# Altium schematic sheet POE_PD.SchDoc
size A3; SheetNumber: 14; SheetTotal: 16
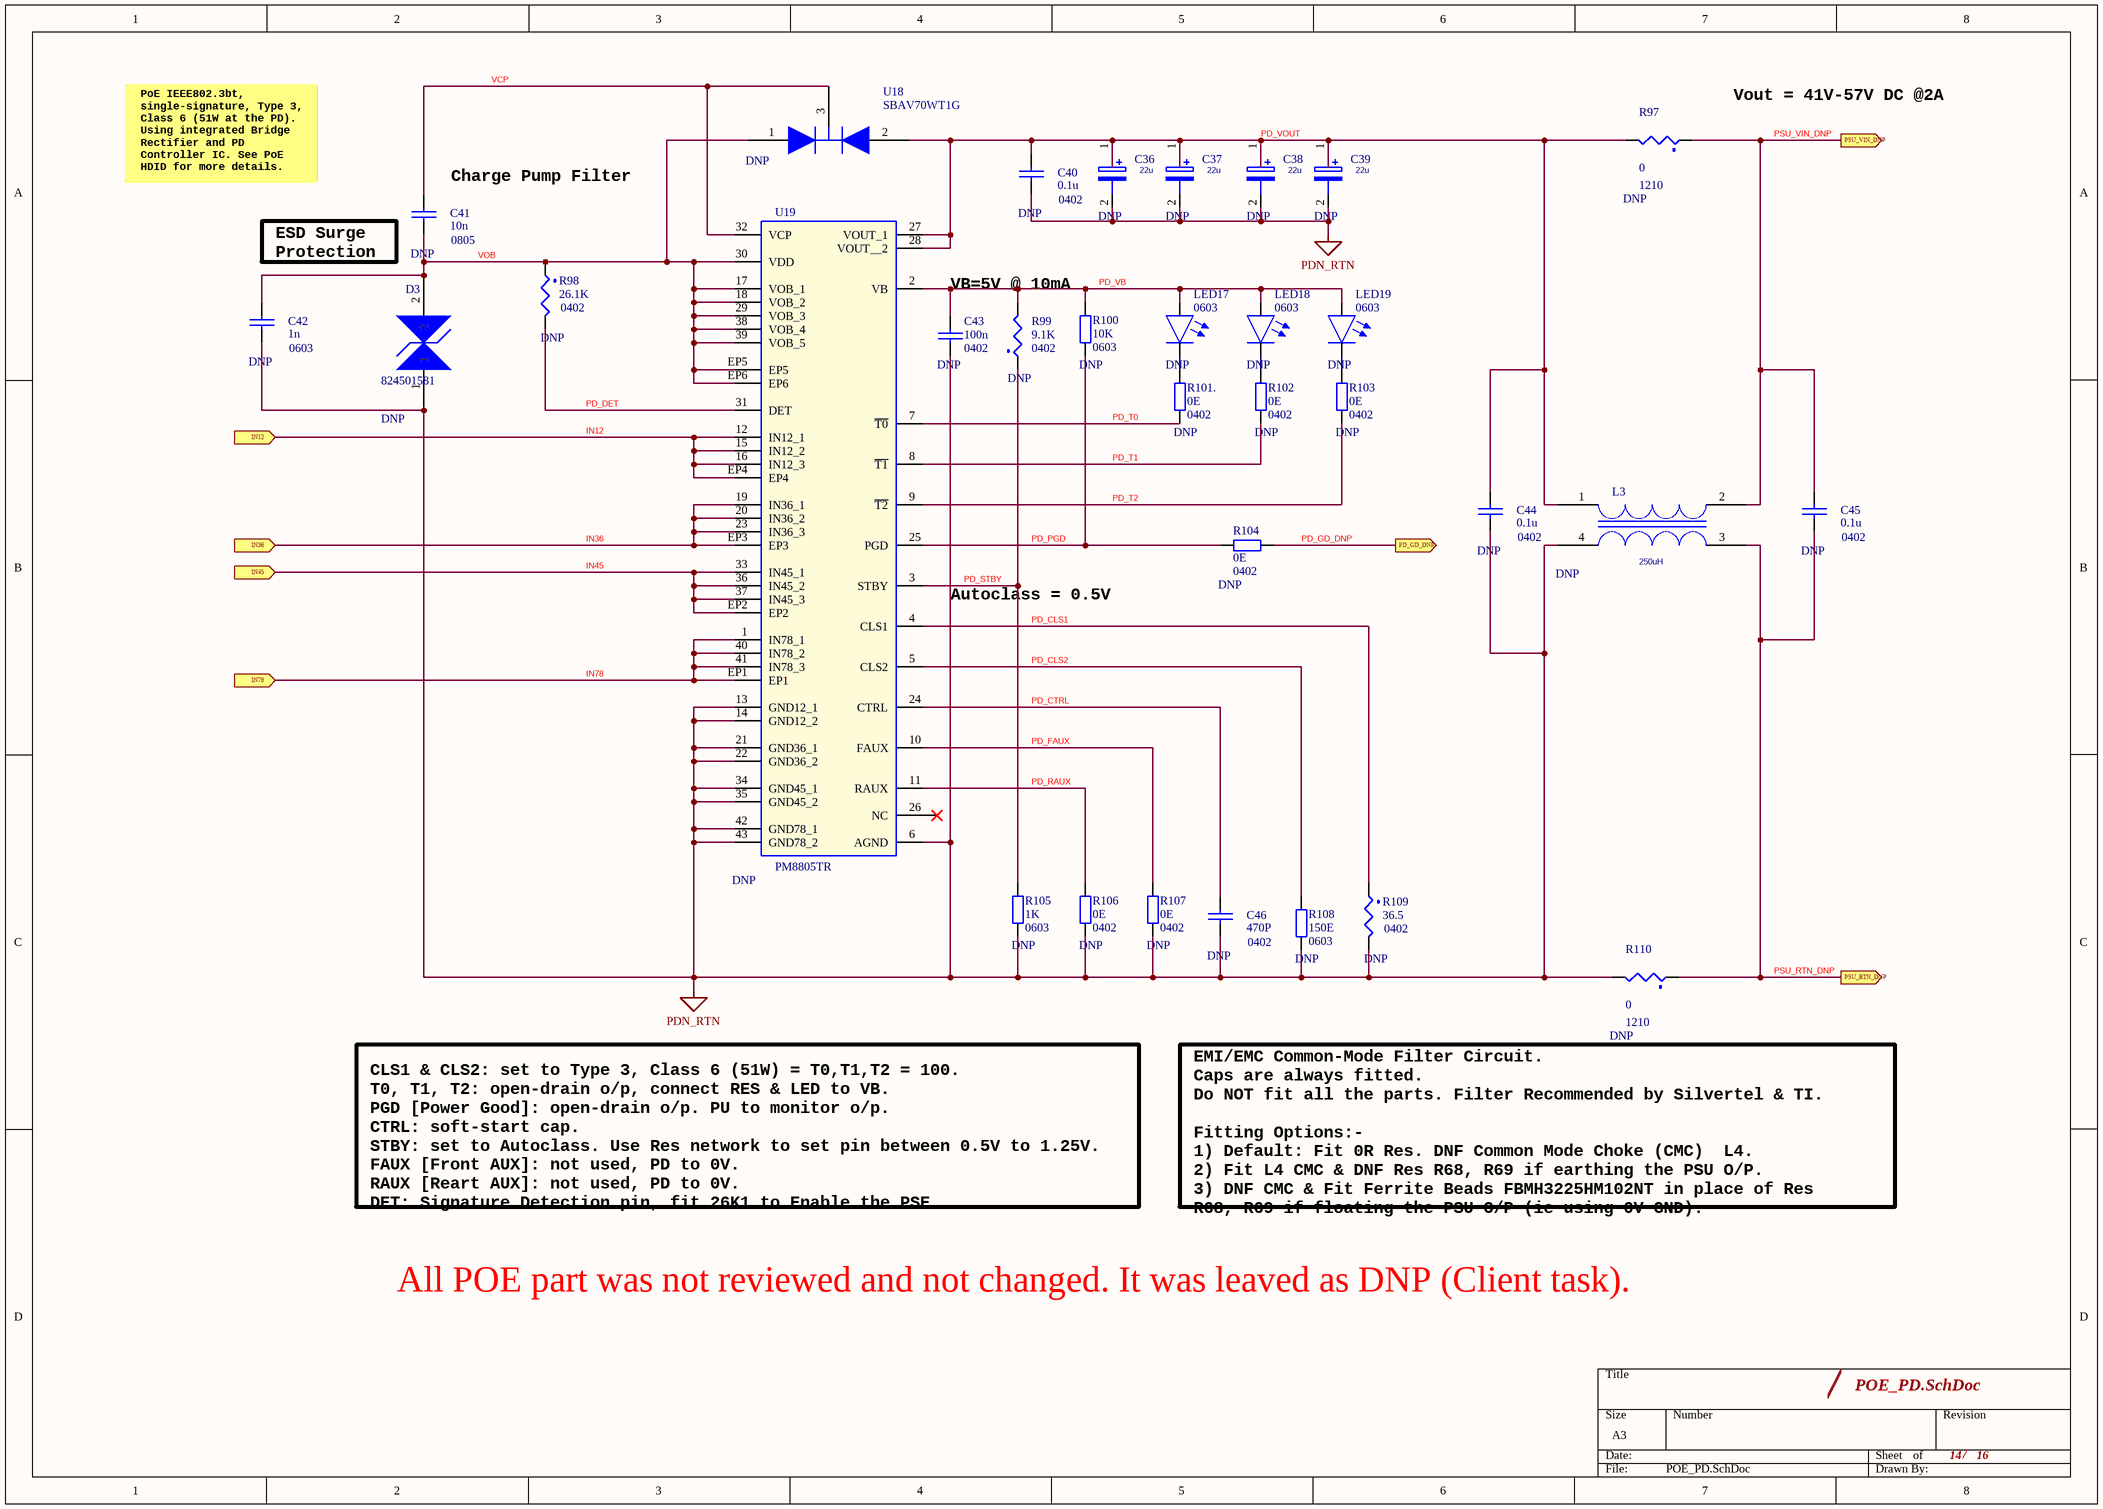
[diagram p0: POE_PD.SchDoc]

## Parts
C36  CAP_V: 22u  [CAPAE830X550N]  (hidden comment: UWX1H220MCL1GB)
C37  CAP_V: 22u  [CAPAE830X550N]  (hidden comment: UWX1H220MCL1GB)
C38  CAP_V: 22u  [CAPAE830X550N]  (hidden comment: UWX1H220MCL1GB)
C39  CAP_V: 22u  [CAPAE830X550N]  (hidden comment: UWX1H220MCL1GB)
C40  0.1u  Foot Print Type: 0402  [c_np_0402]
C41  10n  Foot Print Type: 0805  [cap_sm_0805]
C42  1n  Foot Print Type: 0603  [c_cs_0603]
C43  100n  Foot Print Type: 0402  [c_np_0402]
C44  0.1u  Foot Print Type: 0402  [c_np_0402]
C45  0.1u  Foot Print Type: 0402  [c_np_0402]
C46  470P  Foot Print Type: 0402  [c_np_0402]
D3  824501581  [824501581]
L3  INDUCTANCE: 250uH  [744272251]  (hidden comment: 744272251)
LED17  Size: 0603  [LED_0603(1608)]  (hidden comment: 150060GS75000)
LED18  Size: 0603  [LED_0603(1608)]  (hidden comment: 150060GS75000)
LED19  Size: 0603  [LED_0603(1608)]  (hidden comment: 150060GS75000)
R97  0  Foot Print Size: 1210  [r_sm_1210]
R98  26.1K  Foot Print Size: 0402  [r_sm_0402_r]
R99  9.1K  Foot Print Size: 0402  [r_sm_0402_r]
R100  Resistance: 10K  Size2: 0603  [RESC160X80X55L30]  (hidden comment: RC0603FR-0710KL)
R101.  Resistance: 0E  Size2: 0402  [RESC100X50X40L25]  (hidden comment: AC0402JR-071KL)
R102  Resistance: 0E  Size2: 0402  [RESC100X50X40L25]  (hidden comment: AC0402JR-071KL)
R103  Resistance: 0E  Size2: 0402  [RESC100X50X40L25]  (hidden comment: AC0402JR-071KL)
R104  Resistance: 0E  Size2: 0402  [RESC100X50X40L25]  (hidden comment: AC0402JR-070RL)
R105  Resistance: 1K  Size2: 0603  [RESC160X80X55L30]  (hidden comment: RC0603FR-071KL)
R106  Resistance: 0E  Size2: 0402  [RESC100X50X40L25]  (hidden comment: AC0402JR-070RL)
R107  Resistance: 0E  Size2: 0402  [RESC100X50X40L25]  (hidden comment: AC0402JR-070RL)
R108  Resistance: 150E  Size2: 0603  [RESC160X80X55L30]  (hidden comment: RC0603JR-07150RL)
R109  36.5  Foot Print Size: 0402  [r_sm_0402_r]
R110  0  Foot Print Size: 1210  [r_sm_1210]
U18  SBAV70WT1G  [SOT-323-3_2P2X1P35_ONS]
U19  PM8805TR  [XCVR_PM8805TR]

## Ports
IN12 (in), IN36 (in), IN45 (in), IN78 (in), PD_GD_DNP (out), PSU_RTN_DNP (out), PSU_VIN_DNP (out)

## Nets
PDN_RTN: C36.2(M) C37.2(M) C38.2(M) C39.2(M) C40.2 C42.2 C43.2 C44.2 C46.2 D3.1 L3.4 R105.2 R106.2 R107.2 R108.2 R109.2 R110.2 U19.6(AGND) U19.13(GND12_1) U19.14(GND12_2) U19.21(GND36_1) U19.22(GND36_2) U19.34(GND45_1) U19.35(GND45_2) U19.42(GND78_1) U19.43(GND78_2)
IN12: U19.12(IN12_1) U19.15(IN12_2) U19.16(IN12_3) U19.EP4 ; port IN12
IN36: U19.19(IN36_1) U19.20(IN36_2) U19.23(IN36_3) U19.EP3 ; port IN36
IN45: U19.33(IN45_1) U19.36(IN45_2) U19.37(IN45_3) U19.EP2 ; port IN45
IN78: U19.1(IN78_1) U19.40(IN78_2) U19.41(IN78_3) U19.EP1 ; port IN78
PD_CLS1: R109.1 U19.4(CLS1)
PD_CLS2: R108.1 U19.5(CLS2)
PD_CTRL: C46.1 U19.24(CTRL)
PD_DET: R98.2 U19.31(DET)
PD_FAUX: R107.1 U19.10(FAUX)
PD_GD_DNP: R104.2 ; port PD_GD_DNP
PD_PGD: R100.2 R104.1 U19.25(PGD)
PD_RAUX: R106.1 U19.11(RAUX)
PD_STBY: R99.1 R105.1 U19.3(STBY)
PD_T0: R101..1 U19.7(~{T0})
PD_T1: R102.1 U19.8(~{T1})
PD_T2: R103.1 U19.9(~{T2})
PD_VB: C43.1 LED17.1(Anode) LED18.1(Anode) LED19.1(Anode) R99.2 R100.1 U19.2(VB)
PD_VOUT: C36.1(P) C37.1(P) C38.1(P) C39.1(P) C40.1 C44.1 L3.1 R97.2 U18.2(ANODE_1) U19.27(VOUT_1) U19.28(VOUT__2)
PSU_RTN_DNP: C45.2 L3.3 R110.1 ; port PSU_RTN_DNP
PSU_VIN_DNP: C45.1 L3.2 R97.1 ; port PSU_VIN_DNP
VCP: C41.1 U18.3(CATHODE) U19.32(VCP)
VOB: C41.2 C42.1 D3.2 R98.1 U18.1(ANODE) U19.17(VOB_1) U19.18(VOB_2) U19.29(VOB_3) U19.30(VDD) U19.38(VOB_4) U19.39(VOB_5) U19.EP5 U19.EP6
NetLED17_2: LED17.2(Chatode) R101..2
NetLED18_2: LED18.2(Chatode) R102.2
NetLED19_2: LED19.2(Chatode) R103.2

Not connected (* = marked no-connect by the designer): U19 26(NC)*

## Notes on the sheet
- Vout = 41V-57V DC @2A
- PoE IEEE802.3bt,
  single-signature, Type 3,
  Class 6 (51W at the PD).
  Using integrated Bridge
  Rectifier and PD
  Controller IC. See PoE
  HDID for more details.
- (near C41) Charge Pump Filter
- (near C41) ESD Surge
  Protection
- VB=5V @ 10mA
- Autoclass = 0.5V
- CLS1 & CLS2: set to Type 3, Class 6 (51W) = T0,T1,T2 = 100.
  T0, T1, T2: open-drain o/p, connect RES & LED to VB.
  PGD [Power Good]: open-drain o/p. PU to monitor o/p.
  CTRL: soft-start cap.
  STBY: set to Autoclass. Use Res network to set pin between 0.5V to 1.25V.
  FAUX [Front AUX]: not used, PD to 0V.
  RAUX [Reart AUX]: not used, PD to 0V.
  DET: Signature Detection pin, fit 26K1 to Enable the PSE.
- EMI/EMC Common-Mode Filter Circuit.
  Caps are always fitted.
  Do NOT fit all the parts. Filter Recommended by Silvertel & TI.
  Fitting Options:-
  1) Default: Fit 0R Res. DNF Common Mode Choke (CMC)  L4.
  2) Fit L4 CMC & DNF Res R68, R69 if earthing the PSU O/P.
  3) DNF CMC & Fit Ferrite Beads FBMH3225HM102NT in place of Res
  R68, R69 if floating the PSU O/P (ie using 0V GND).
- All POE part was not reviewed and not changed. It was leaved as DNP (Client task).
- /

## Library data of the parts
C36-C39 = UWX1H220MCL1GB: Nichicon 22uF 50 V Aluminium Electrolytic Capacitor SMD, WX Series 2000h 8 (Dia.) x 5.4mm; OriginalSymbolOrigin: (0,0); PCB Footprint: cap_sm_1210; DeviceNumbering: Alpha; DeviceDesignator: A; DevicesInPackage: 1; IsHeterogeneous: False; Voltage: 65V; Tollerance: 5%; Height: 5.5 mm; Datasheet Link: http://www.nichicon.co.jp/english/products/pdfs/e-uwx.pdf; Arrow Price/Stock: https://www.arrow.com/en/products/uwx1h220mcl1gb/nichicon; Arrow Part Number: UWX1H220MCL1GB; Mouser Part Number: 647-UWX1H220MCL1; Manufacturer_Part_Number: UWX1H220MCL1GB; Manufacturer_Name: Nichicon; DevicesInView: 1; PackageName: UWX1H220MCL1GB; DNP: DNP
C40 = CAP_NP: CLASS: DISCRETE; Tollerance: 5%; Voltage: 50V; PCB Footprint: c_np_0402; DNP: DNP
C41 = CAP_NP: CLASS: DISCRETE; Tollerance: 1%; Voltage: 50V; PCB Footprint: cap_sm_0805; DNP: DNP
C42 C46 = CAP_NP: CLASS: DISCRETE; Voltage: 50V; Tollerance: 1%; DNP: DNP
  C42: PCB Footprint: c_cs_0603
  C46: PCB Footprint: c_np_0402
C43 = CAP_NP: CLASS: DISCRETE; PCB Footprint: c_np_0402; DNP: DNP
C44 C45 = CAP_NP: CLASS: DISCRETE; Voltage: 50V; Tollerance: 5%; PCB Footprint: c_np_0402; DNP: DNP
LED17-LED19 = LED_0603_SMD: LED GREEN CLEAR 0603 SMD; MPN: 150060GS75000; ComponentLink1Description: DigiKey; ComponentLink1URL: https://www.digikey.com/en/products/detail/w%C3%BCrth-elektronik/150060gs75000/4489898; DNP: DNP
R97 = SMD_RESISTOR: Voltage: 50V; Tollerance: 5%; PCB Footprint: r_sm_1210; DNP: DNP
R98 R99 = SMD_RESISTOR: Tollerance: 1%; Voltage: 50V; PCB Footprint: r_sm_0402_r; DNP: DNP
R100 = CMP-001-0628-7: RES 10K OHM 1% 1/10W 0603; Manufacturer: YAGEO; Power: 100mW; Temperature Coefficient: ±100ppm; Op Temp max: 155°C; Op Temp min: -55°C; PMNT: DNP; Ratings: -; ComponentLink3URL: https://www.digikey.com/en/products/detail/yageo/RC0603FR-0710KL/726880?s=N4IgTCBcDaIEoGEAMA2JBmAYnAtEg7AIxIDSAMiALoC%2BQA; Size: 1.60mm x 0.80mm; ComponentLink1Description: Datasheet; ComponentLink3Description: Digikey; ComponentLink2Description: Mouser; ComponentLink1URL: https://www.yageo.com/upload/media/product/products/datasheet/rchip/PYu-RC_51_RoHS_P_4.pdf; Composition: Thick Film; Package: 0603 (1608 Metric); ComponentLink2URL: https://eu.mouser.com/ProductDetail/YAGEO/RC0603FR-0710KL?qs=grNVn54RoB%252B3GtjbJj3wJQ%3D%3D; Mounting Type: SM; Tolerance: 1%; Height max: 550µm; MPN: RC0603FR-0710KL; Component Type: Chip Resistor; DNP: DNP
R101. R102 R103 = CMP-001-0484-6: RES SMD 1K OHM 1/16W 0402; Manufacturer: YAGEO; Power: 63mW; Op Temp min: -55°C; Temperature Coefficient: ±100ppm; Op Temp max: 155°C; ComponentLink3URL: https://www.digikey.com/en/products/detail/yageo/ac0402jr-071kl/5895603; Ratings: -; Height max: 400µm; MPN: AC0402JR-071KL; Size: 1.00mm x 0.50mm; Composition: Thick Film; Package: 0402 (1005 Metric); ComponentLink3Description: Digikey; Mounting Type: SM; Component Type: Chip Resistor; DNP: DNP
R104 R106 R107 = CMP-001-0484-6: RES SMD 0 OHM JUMPER 1/16W 0402; Manufacturer: YAGEO; Power: 63mW; Op Temp min: -55°C; Temperature Coefficient: ±100ppm; Op Temp max: 155°C; ComponentLink3URL: https://www.digikey.com/en/products/detail/yageo/RC0402FR-0727RL/5280946; ComponentLink2Description: Mouser; Ratings: -; Tolerance: Jumper; Height max: 400µm; MPN: AC0402JR-070RL; ComponentLink1URL: https://www.yageo.com/upload/media/product/productsearch/datasheet/rchip/PYu-RC_Group_51_RoHS_L_12.pdf; Size: 1.00mm x 0.50mm; Composition: Thick Film; Package: 0402 (1005 Metric); ComponentLink3Description: Digikey; Mounting Type: SM; ComponentLink2URL: https://eu.mouser.com/ProductDetail/YAGEO/RC0402FR-0727RL?qs=UOUeRUa%252B8Wlb37UyFHw9Bw%3D%3D; ComponentLink1Description: Datasheet; Component Type: Chip Resistor; DNP: DNP
R105 = CMP-001-0628-7: RES 1K OHM 1% 1/10W 0603; Manufacturer: YAGEO; Power: 100mW; Temperature Coefficient: ±100ppm; Op Temp max: 155°C; Op Temp min: -55°C; Ratings: -; ComponentLink3URL: https://www.digikey.com/en/products/detail/yageo/RC0603FR-0710KL/726880?s=N4IgTCBcDaIEoGEAMA2JBmAYnAtEg7AIxIDSAMiALoC%2BQA; Size: 1.60mm x 0.80mm; ComponentLink1Description: Datasheet; ComponentLink3Description: Digikey; ComponentLink1URL: https://www.digikey.ee/en/products/detail/yageo/rc0603fr-07100rp/4935304; Composition: Thick Film; Package: 0603 (1608 Metric); Mounting Type: SM; Tolerance: 1%; Height max: 550µm; MPN: RC0603FR-071KL; Component Type: Chip Resistor; DNP: DNP
R108 = CMP-001-0628-7: RES 150 OHM 5% 1/10W 0603; Manufacturer: YAGEO; Power: 100mW; Temperature Coefficient: ±100ppm; Tolerance: 1%; Op Temp max: 155°C; Op Temp min: -55°C; Ratings: -; ComponentLink3URL: https://www.digikey.com/en/products/detail/yageo/RC0603FR-0710KL/726880?s=N4IgTCBcDaIEoGEAMA2JBmAYnAtEg7AIxIDSAMiALoC%2BQA; Size: 1.60mm x 0.80mm; ComponentLink1Description: Datasheet; ComponentLink3Description: Digikey; ComponentLink2Description: Mouser; ComponentLink1URL: https://www.yageo.com/upload/media/product/products/datasheet/rchip/PYu-RC_51_RoHS_P_4.pdf; Composition: Thick Film; Package: 0603 (1608 Metric); ComponentLink2URL: https://eu.mouser.com/ProductDetail/YAGEO/RC0603FR-0710KL?qs=grNVn54RoB%252B3GtjbJj3wJQ%3D%3D; Mounting Type: SM; Height max: 550µm; MPN: RC0603JR-07150RL; Component Type: Chip Resistor; DNP: DNP
R109 = SMD_RESISTOR: Voltage: 50V; Tollerance: 0.5%; PCB Footprint: r_sm_0402_r; DNP: DNP
R110 = SMD_RESISTOR: Tollerance: 5%; Voltage: 50V; PCB Footprint: r_sm_1210; DNP: DNP
U18 = SBAV70WT1G: Mfr_Name: onsemi; Manufacturer_Part_Number: SBAV70WT1G; Copyright: Copyright (C) 2022 Ultra Librarian. All rights reserved.; PCB Footprint: SOT-323-3_2P2X1P35_ONS; DNP: DNP
U19 = PM8805TR: OriginalSymbolOrigin: (-50000,170000); PCB Footprint: XCVR_PM8805TR; DNP: DNP
D3 = 824501581: PCB Footprint: 824501581; DNP: DNP
L3 = 744272251: PCB Footprint: 744272251; DNP: DNP